# Altium schematic sheet 54_ANALOG_POWER.SchDoc
size A4; SheetNumber: 15; SheetTotal: 16
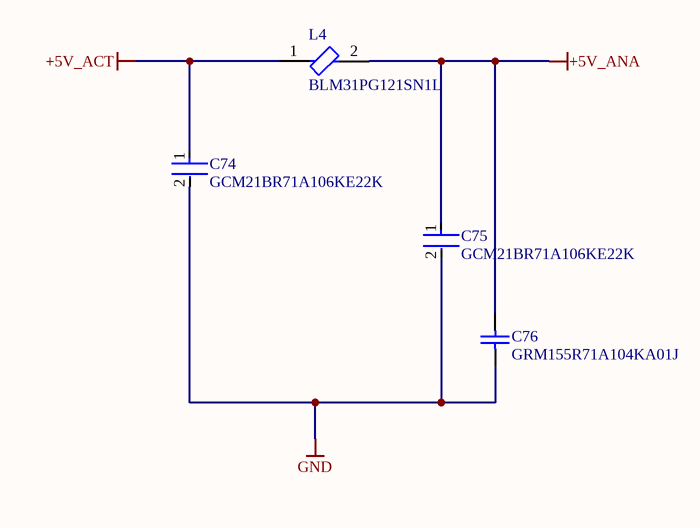
[diagram p0: 54_ANALOG_POWER.SchDoc]

## Parts
C74  GCM21BR71A106KE22K  [FP-GCM21B-0_15-MFG]
C75  GCM21BR71A106KE22K  [FP-GCM21B-0_15-MFG]
C76  GRM155R71A104KA01J  [CAPC1005X55X25ML05T10]
L4  BLM31PG121SN1L  [FP-BLM31-0_2-t1_1-MFG]

## Nets
+5V_ACT: C74.1 L4.1
+5V_ANA: C75.1 C76.2 L4.2
GND: C74.2 C75.2 C76.1

## Library data of the parts
C74 C75 = CMP-06035-062139-1: Ceramic Capacitor for Automotive 10uF ±10% 10VDC X7R 0805 Embossed T/R; Voltage Rating: 10V; Mount: Surface Mount; Max Operating Temperature: 125°C; Tolerance: 10%; Voltage Rating (DC): 10V; Dielectric: X7R; RoHS Compliant: Yes; Package Quantity: 10000; Min Operating Temperature: -55°C; Case/Package: 0805; Case Code (Imperial): 0805; Thickness: 0.055inch; Weight: 0.000335oz; Length: 0.079inch; Ratings: AEC-Q200; Case Code (Metric): 2012; Termination: SMD/SMT; Width: 1.25mm; Height: 1.25mm; Packaging: Tape and Reel; Capacitance: 10uF
C76 = CMP-2008-04031-1: Manufacturer: Murata; Part Number: GRM155R71A104KA01J
L4 = CMP-0686-00732-3: Chip Ferrite Bead Array, 1206, 120Ω @ 100MHz, 0.02Ω, 25%, 3.5A; Number of Lines: 1; DC Current: 3A; Impedance: 120R; Material: Steel; DC Resistance (DCR): 20mR; Shielding: Unshielded; Number of Pins: 2; Case Code (Metric): 3216; Contact Plating: Tin; Radiation Hardening: No; Termination: SMD/SMT; Lead Free: Lead Free; Core Material: Ferrite; Case Code (Imperial): 1206; Test Frequency: 100MHz; Depth: 1.6mm; Max Operating Temperature: 125°C; Package Quantity: 3000; Packaging: Tape and Reel; Min Operating Temperature: -55°C; Length: 3.2mm; Current Rating: 3.5A; RoHS Compliant: Yes; Tolerance: 25%; Width: 1.6mm; Max Current Rating: 3.5A; Frequency: 100MHz; Military Standard: Not; Case/Package: 1206; Max DC Current: 3A; Height: 1.1mm